# Altium schematic sheet GSM_Sheet.SchDoc (part 1 of 3)
size 420 x 297 mm; SheetNumber: 2; SheetTotal: 4
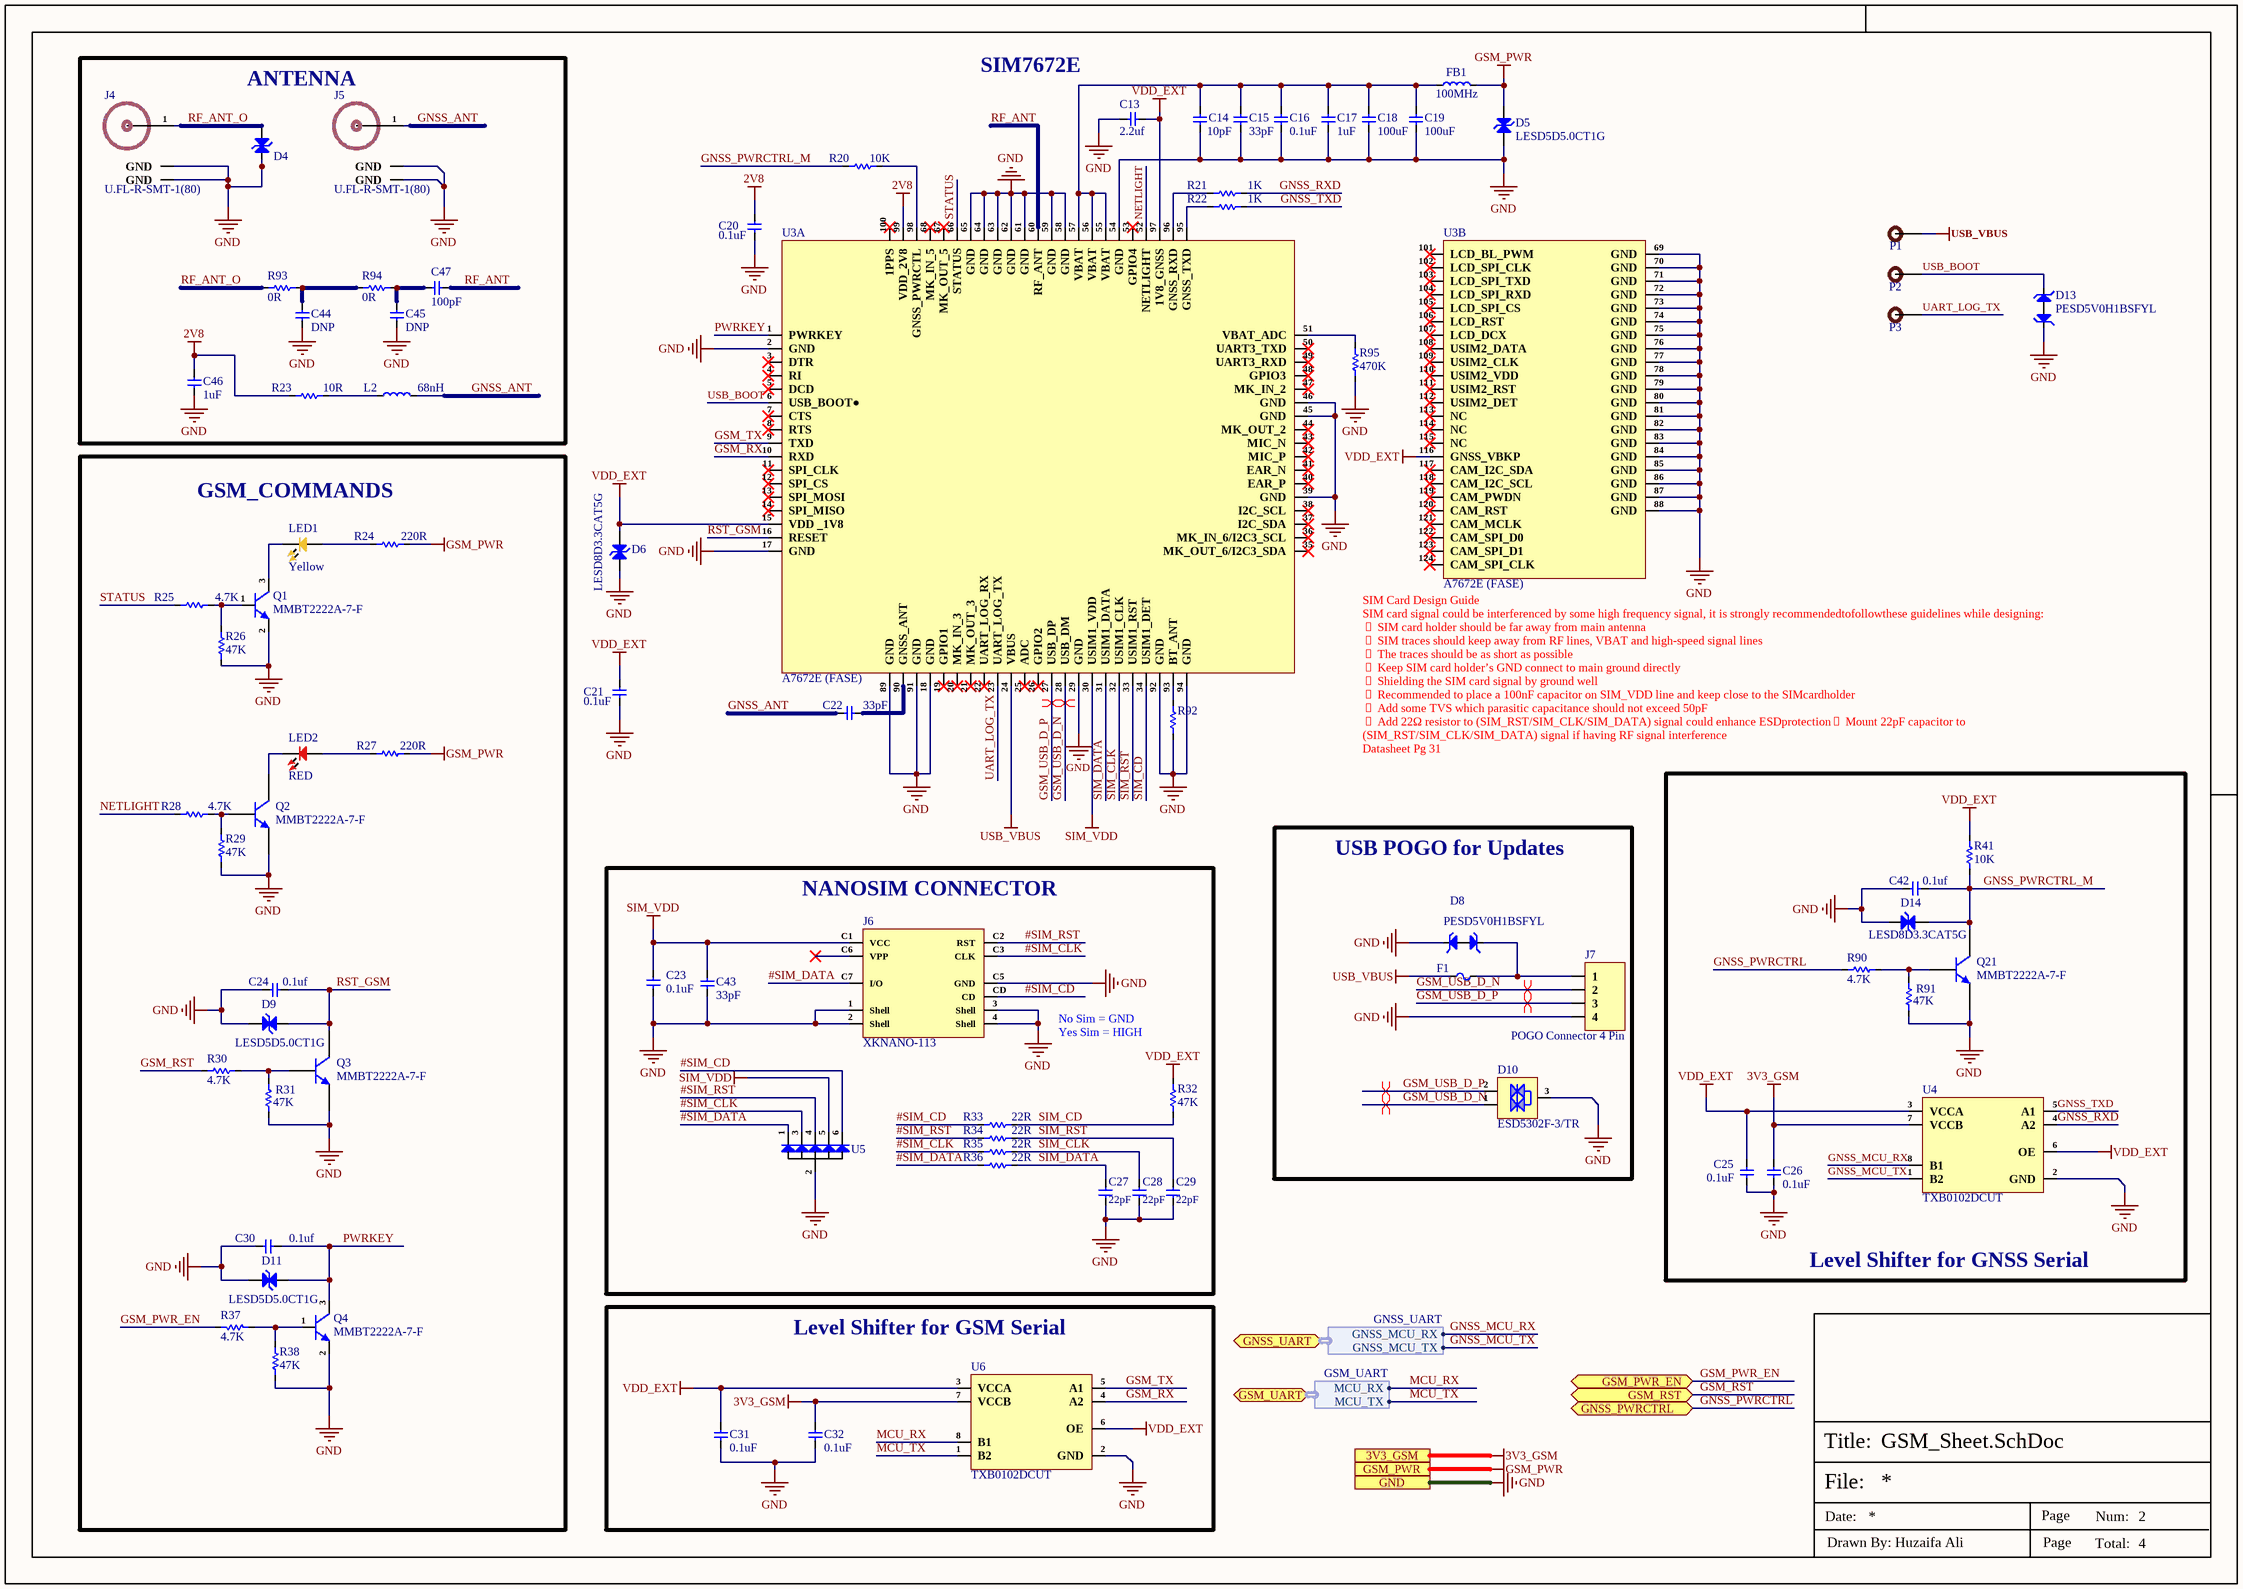
[diagram p0: GSM_Sheet.SchDoc]

## Parts
C13  2.2uf  [Cap-0402]
C14  10pF  [Cap-0402]
C15  33pF  [Cap-0402]
C16  0.1uF  [Cap-0402]
C17  1uF  [Cap-0402]
C18  100uF  [Cap-1206]
C19  100uF  [Cap-1206]
C20  0.1uF  [CAP-0201]
C21  0.1uF  [CAP-0201]
C22  33pF  [Cap-0402]
C23  0.1uF  [CAP-0201]
C24  0.1uf  [Cap-0402]
C25  0.1uF  [CAP-0201]
C26  0.1uF  [CAP-0201]
C27  22pF  [CAP-0201]
C28  22pF  [CAP-0201]
C29  22pF  [CAP-0201]
C30  0.1uf  [Cap-0402]
C31  0.1uF  [CAP-0201]
C32  0.1uF  [CAP-0201]
C42  0.1uf  [Cap-0402]
C43  33pF  [Cap-0402]
C44  DNP  [Cap-0402]
C45  DNP  [Cap-0402]
C46  1uF  [Cap-0402]
C47  100pF  [Cap-0402]
D4  TPESD0402G03V  [TPESD0402G03V]  (value not drawn)
D5  LESD5D5.0CT1G  [SOD-523]
D6  LESD8D3.3CAT5G  [SOD-882 Bi Directional]
D8  PESD5V0H1BSFYL  [DSN0603-2]
D9  LESD5D5.0CT1G  [SOD-523 (Bi-Directional)]
D10  ESD5302F-3/TR  [Sot-23]
D11  LESD5D5.0CT1G  [SOD-523 (Bi-Directional)]
D13  PESD5V0H1BSFYL  [DSN0603-2]
D14  LESD8D3.3CAT5G  [SOD-882 Bi Directional]
F1  SMD0603-050  [Fuse-0603]  (value not drawn)
FB1  100MHz  [Ind-0805]
J4  U.FL-R-SMT-1(80)  [U.FL-R-SMT-1(80)_]
J5  U.FL-R-SMT-1(80)  [U.FL-R-SMT-1(80)_]
J6  XKNANO-113  [XKNANO-113]
J7  POGO Connector 4 Pin  [Pogo 4 Pin]
L2  68nH  [IND-0603 (1608 Metric)]
LED1  Yellow  [LED-0603]
LED2  RED  [LED-0603]
P1  TEST POINT  [Test-point]  (value not drawn)
P2  TEST POINT  [Test-point]  (value not drawn)
P3  TEST POINT  [Test-point]  (value not drawn)
Q1  MMBT2222A-7-F  [SOT-23]
Q2  MMBT2222A-7-F  [SOT-23]
Q3  MMBT2222A-7-F  [SOT-23]
Q4  MMBT2222A-7-F  [SOT-23]
Q21  MMBT2222A-7-F  [SOT-23]
R20  10K  [Res-0402]
R21  1K  [Res-0201]
R22  1K  [Res-0201]
R23  10R  [Res-0402]
R24  220R  [Res-0603]
R25  4.7K  [Res-0402]
R26  47K  [Res-0402]
R27  220R  [Res-0603]
R28  4.7K  [Res-0402]
R29  47K  [Res-0402]
R30  4.7K  [Res-0402]
R31  47K  [Res-0402]
R32  47K  [Res-0402]
R33  22R  [Res-0201]
R34  22R  [Res-0201]
R35  22R  [Res-0201]
R36  22R  [Res-0201]
R37  4.7K  [Res-0402]
R38  47K  [Res-0402]
R41  10K  [Res-0402]
R90  4.7K  [Res-0402]
R91  47K  [Res-0402]
R92  51R  [Res-1206]  (value not drawn)
R93  0R  [Res-0402]
R94  0R  [Res-0402]
R95  470K  [Res-0402]
U3  A7672E (FASE)  [A7672E (FASE)]  (parts A,B of 2)
U4  TXB0102DCUT  [TXB0102DCUT]
U5  SMF05CT1G-ES  [SOT-363]  (value not drawn)
U6  TXB0102DCUT  [TXB0102DCUT]

## Blocks framed on the sheet
ANTENNA: C44-C47 D4 J4 J5 L2 R23 R93 R94
GSM_COMMANDS: C24 C30 D9 D11 LED1 LED2 Q1-Q4 R24-R31 R37 R38
Level Shifter for GNSS Serial: C25 C26 C42 D14 Q21 R41 R90 R91 U4
USB POGO for Updates: D8 D10 F1 J7
NANOSIM CONNECTOR: C23 C27-C29 C43 J6 R32-R36 U5
Level Shifter for GSM Serial: C31 C32 U6

## Ports
3V3_GSM (see Power-Sheet[1D]), GND (see Heater_Sheet[1D], Power-Sheet[1D], Ultrasonic_NFC_Sheet[1D]), GNSS_PWRCTRL (bidir, see Power-Sheet[4D]), GNSS_UART (bidir, harness GNSS_UART, see Power-Sheet[2D]), GSM_PWR (see Power-Sheet[1D]), GSM_PWR_EN (bidir, see Power-Sheet[4D]), GSM_RST (bidir, see Power-Sheet[4D]), GSM_UART (bidir, harness GSM_UART, see Power-Sheet[2D])

## Harnesses
GSM_UART: MCU_RX, MCU_TX
GNSS_UART: GNSS_MCU_RX, GNSS_MCU_TX

## Nets
2V8: C20.1 C46.2 R23.1 U3.99(VDD_2V8)
3V3_GSM: C26.2 C32.1 U4.7(VCCB) U6.7(VCCB) ; port 3V3_GSM
GND: C13.2 C14.1 C15.1 C16.1 C17.1 C18.1 C19.1 C20.2 C21.2 C23.2 C24.1 C25.1 C26.1 C27.1 C28.1 C29.1 C30.1 C31.2 C32.2 C42.1 C43.1 C44.1 C45.1 C46.1 D4.1(A) D5.1(A) D6.2(A) D8.1 D9.1(A) D10.3(GND) D11.1(A) D13.1 D14.2(A) J4.2(GND) J4.3(GND) J5.2(GND) J5.3(GND) J6.1(Shell) J6.2(Shell) J6.3(Shell) J6.4(Shell) J6.C5(GND) J7.4 Q1.2(E) Q2.2(E) Q3.2(E) Q4.2(E) Q21.2(E) R26.1 R29.1 R31.1 R38.1 R91.1 R92.1 R95.1 U3.2(GND) U3.17(GND) U3.18(GND) U3.29(GND) U3.39(GND) U3.45(GND) U3.46(GND) U3.54(GND) U3.58(GND) U3.59(GND) U3.61(GND) U3.62(GND) U3.63(GND) U3.64(GND) U3.65(GND) U3.69(GND) U3.70(GND) U3.71(GND) U3.72(GND) U3.73(GND) U3.74(GND) U3.75(GND) U3.76(GND) U3.77(GND) U3.78(GND) U3.79(GND) U3.80(GND) U3.81(GND) U3.82(GND) U3.83(GND) U3.84(GND) U3.85(GND) U3.86(GND) U3.87(GND) U3.88(GND) U3.89(GND) U3.91(GND) U3.92(GND) U3.94(GND) U4.2(GND) U5.2(A) U6.2(GND) ; port GND
GSM_PWR: D5.2(A) FB1.2 R24.2 R27.2 ; port GSM_PWR
SIM_VDD: C23.1 C43.2 J6.C1(VCC) U3.30(USIM1_VDD) U5.5(IO4)
USB_VBUS: F1.1 P1.1 U3.24(VBUS)
VDD_EXT: C13.1 C21.1 C25.2 C31.1 D6.1(A) R32.1 R41.2 U3.15(VDD__1V8) U3.97(1V8_GNSS) U3.116(GNSS_VBKP) U4.3(VCCA) U4.6(OE) U6.3(VCCA) U6.6(OE)
#SIM_CD: J6.CD R33.1 U5.6(IO5)
#SIM_CLK: J6.C3(CLK) R35.1 U5.3(IO2)
#SIM_DATA: J6.C7(I/O) R36.1 U5.1(IO1)
#SIM_RST: J6.C2(RST) R34.1 U5.4(IO3)
GNSS_ANT: C22.2 J5.1(RF_IN) L2.2
GNSS_MCU_RX: U4.8(B1) ; port GNSS_UART.GNSS_MCU_RX
GNSS_MCU_TX: U4.1(B2) ; port GNSS_UART.GNSS_MCU_TX
GNSS_PWRCTRL: R90.1 ; port GNSS_PWRCTRL
GNSS_PWRCTRL_M: C42.2 D14.1(A) Q21.3(C) R20.2 R41.1
GNSS_RXD: R21.2 U4.4(A2)
GNSS_TXD: R22.2 U4.5(A1)
GSM_PWR_EN: R37.2 ; port GSM_PWR_EN
GSM_RST: R30.1 ; port GSM_RST
GSM_RX: U3.10(RXD) U6.4(A2)
GSM_TX: U3.9(TXD) U6.5(A1)
GSM_USB_D_N: D10.1(I/O1) J7.2 U3.28(USB_DM)
GSM_USB_D_P: D10.2(I/O2) J7.3 U3.27(USB_DP)
MCU_RX: U6.8(B1) ; port GSM_UART.MCU_RX
MCU_TX: U6.1(B2) ; port GSM_UART.MCU_TX
NETLIGHT: R28.1 U3.52(NETLIGHT)
PWRKEY: C30.2 D11.2(A) Q4.3(C) U3.1(PWRKEY)
RF_ANT: C47.2 U3.60(RF_ANT)
RF_ANT_O: D4.2(A) J4.1(RF_IN) R93.1
RST_GSM: C24.2 D9.2(A) Q3.3(C) U3.16(RESET)
SIM_CD: R32.2 R33.2 U3.34(USIM1_DET)
SIM_CLK: C28.2 R35.2 U3.32(USIM1_CLK)
SIM_DATA: C27.2 R36.2 U3.31(USIM1_DATA)
SIM_RST: C29.2 R34.2 U3.33(USIM1_RST)
STATUS: R25.1 U3.66(STATUS)
UART_LOG_TX: P3.1 U3.23(UART_LOG_TX)
USB_BOOT: D13.2 P2.1 U3.6(USB_BOOT●)
NetC14_2: C14.2 C15.2 C16.2 C17.2 C18.2 C19.2 FB1.1 U3.55(VBAT) U3.56(VBAT) U3.57(VBAT)
NetC22_1: C22.1 U3.90(GNSS_ANT)
NetC44_2: C44.2 R93.2 R94.1
NetC45_2: C45.2 C47.1 R94.2
NetD8_2: D8.2 F1.2 J7.1
NetL2_1: L2.1 R23.2
NetLED1_1: LED1.1 R24.1
NetLED1_2: LED1.2 Q1.3(C)
NetLED2_1: LED2.1 R27.1
NetLED2_2: LED2.2 Q2.3(C)
NetQ1_1: Q1.1(B) R25.2 R26.2
NetQ2_1: Q2.1(B) R28.2 R29.2
NetQ3_1: Q3.1(B) R30.2 R31.2
NetQ4_1: Q4.1(B) R37.1 R38.2
NetQ21_1: Q21.1(B) R90.2 R91.2
NetR20_1: R20.1 U3.98(GNSS_PWRCTL)
NetR21_1: R21.1 U3.96(GNSS_RXD)
NetR22_1: R22.1 U3.95(GNSS_TXD)
NetR92_2: R92.2 U3.93(BT_ANT)
NetR95_2: R95.2 U3.51(VBAT_ADC)

Not connected (* = marked no-connect by the designer): J6 C6(VPP)*; U3 3(DTR)* 4(RI)* 5(DCD)* 7(CTS)* 8(RTS)* 11(SPI_CLK)* 12(SPI_CS)* 13(SPI_MOSI)* 14(SPI_MISO)* 19(GPIO1)* 20(MK_IN_3)* 21(MK_OUT_3)* 22(UART_LOG_RX)* 25(ADC)* 26(GPIO2)* 35(MK_OUT_6/I2C3_SDA)* 36(MK_IN_6/I2C3_SCL)* 37(I2C_SDA)* 38(I2C_SCL)* 40(EAR_P)* 41(EAR_N)* 42(MIC_P)* 43(MIC_N)* 44(MK_OUT_2)* 47(MK_IN_2)* 48(GPIO3)* 49(UART3_RXD)* 50(UART3_TXD)* 53(GPIO4)* 67(MK_OUT_5)* 68(MK_IN_5)* 100(1PPS)* 101(LCD_BL_PWM)* 102(LCD_SPI_CLK)* 103(LCD_SPI_TXD)* 104(LCD_SPI_RXD)* 105(LCD_SPI_CS)* 106(LCD_RST)* 107(LCD_DCX)* 108(USIM2_DATA)* 109(USIM2_CLK)* 110(USIM2_VDD)* 111(USIM2_RST)* 112(USIM2_DET)* 113(NC)* 114(NC)* 115(NC)* 117(CAM_I2C_SDA)* 118(CAM_I2C_SCL)* 119(CAM_PWDN)* 120(CAM_RST)* 121(CAM_MCLK)* 122(CAM_SPI_D0)* 123(CAM_SPI_D1)* 124(CAM_SPI_CLK)*

## Layout directives
differential pair; net class GSM_USB; differential pair class GSM_USB_Lines; rule Impedance Constraint [Min = 88.00    Max = 90.00    ]; rule Matched Net Lengths [Tolerance = 20mil]: GSM_USB_D_N, GSM_USB_D_P
differential pair: GSM_USB_D_N, GSM_USB_D_P

## Notes on the sheet
- SIM7672E
- (near U3) SIM Card Design Guide
  SIM card signal could be interferenced by some high frequency signal, it is strongly recommendedtofollowthese guidelines while designing:
   SIM card holder should be far away from main antenna
   SIM traces should keep away from RF lines, VBAT and high-speed signal lines
   The traces should be as short as possible
   Keep SIM card holder’s GND connect to main ground directly
   Shielding the SIM card signal by ground well
   Recommended to place a 100nF capacitor on SIM_VDD line and keep close to the SIMcardholder
   Add some TVS which parasitic capacitance should not exceed 50pF
   Add 22Ω resistor to (SIM_RST/SIM_CLK/SIM_DATA) signal could enhance ESDprotection Mount 22pF capacitor to (SIM_RST/SIM_CLK/SIM_DATA) signal if having RF signal interference
  Datasheet Pg 31
- No Sim = GND
  Yes Sim = HIGH
- File:
- Title:
- Date:
- Page
- Num:
- Total:
- Drawn By: Huzaifa Ali